# Altium schematic sheet 1_LiPo_Charger.schdoc
size 289 x 200 mm; Name: default297x210; Symbol: default297x210; Device: default297x210; Size: "A4"; Id: /; File: LiPo Charger; Sheet: /; SheetNumber: 12; SheetTotal: 17
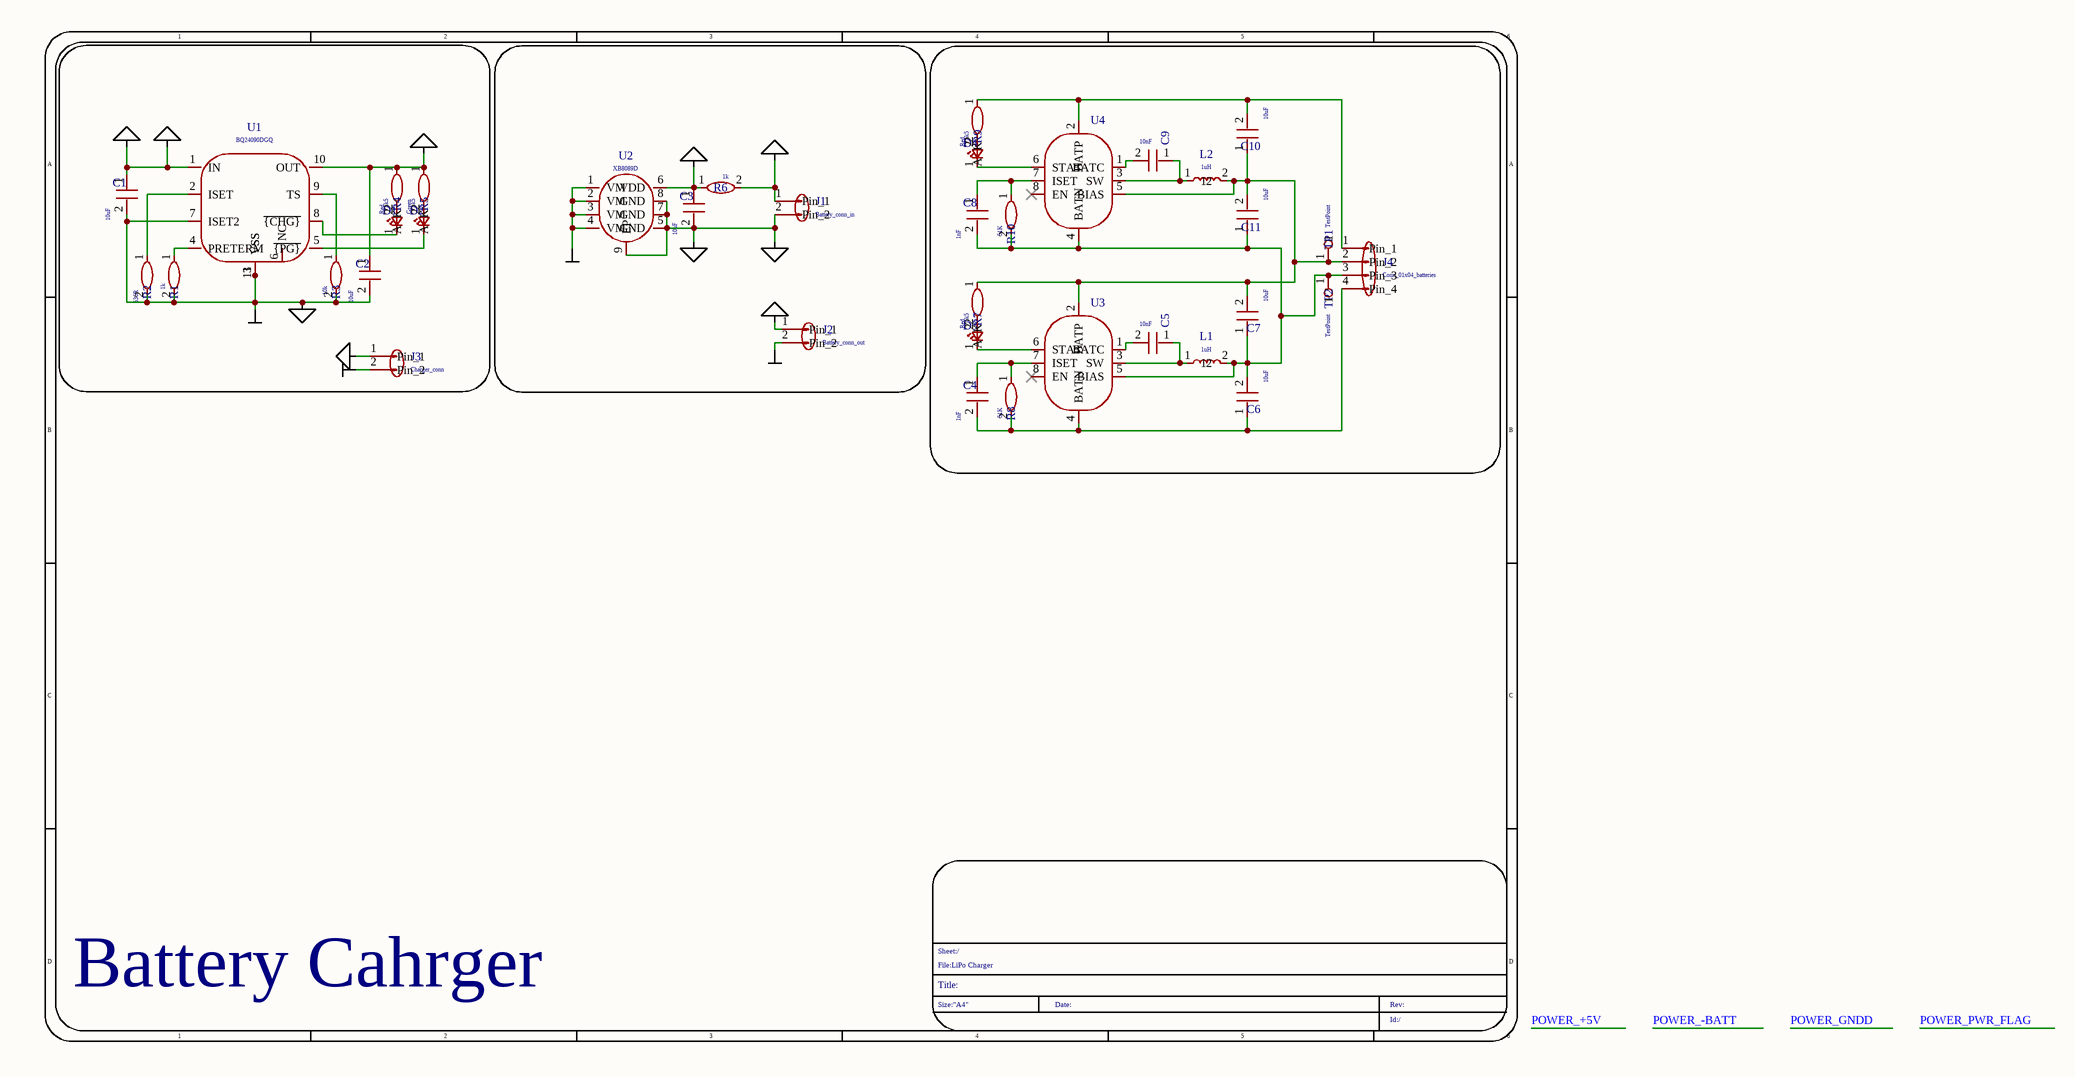
[diagram p0: 1_LiPo_Charger.schdoc]

## Parts
C1  value 10uF  [Capacitor_SMD:C_0402_1005Metric_Pad0.74x0.62mm_HandSolder]  (hidden comment: Device_C)
C2  value 10uF  [Capacitor_SMD:C_0402_1005Metric_Pad0.74x0.62mm_HandSolder]  (hidden comment: Device_C)
C3  value 10uF  [Capacitor_SMD:C_0402_1005Metric_Pad0.74x0.62mm_HandSolder]  (hidden comment: Device_C)
C4  value 1nF  [Capacitor_SMD:C_0402_1005Metric_Pad0.74x0.62mm_HandSolder]  (hidden comment: Device_C)
C5  value 10nF  [Capacitor_SMD:C_0402_1005Metric_Pad0.74x0.62mm_HandSolder]  (hidden comment: Device_C)
C6  value 10uF  [Capacitor_SMD:C_0402_1005Metric_Pad0.74x0.62mm_HandSolder]  (hidden comment: Device_C)
C7  value 10uF  [Capacitor_SMD:C_0402_1005Metric_Pad0.74x0.62mm_HandSolder]  (hidden comment: Device_C)
C8  value 1nF  [Capacitor_SMD:C_0402_1005Metric_Pad0.74x0.62mm_HandSolder]  (hidden comment: Device_C)
C9  value 10nF  [Capacitor_SMD:C_0402_1005Metric_Pad0.74x0.62mm_HandSolder]  (hidden comment: Device_C)
C10  value 10uF  [Capacitor_SMD:C_0402_1005Metric_Pad0.74x0.62mm_HandSolder]  (hidden comment: Device_C)
C11  value 10uF  [Capacitor_SMD:C_0402_1005Metric_Pad0.74x0.62mm_HandSolder]  (hidden comment: Device_C)
D1  value Red  [SparkFun-LED:LED_0603_1608Metric_Red]  (hidden comment: SparkFun-LED_LED_Red_0603)
D2  value Green  [SparkFun-LED:LED_0603_1608Metric_Green]  (hidden comment: SparkFun-LED_LED_Green_0603)
D3  value Red  [SparkFun-LED:LED_0603_1608Metric_Red]  (hidden comment: SparkFun-LED_LED_Red_0603)
D4  value Red  [SparkFun-LED:LED_0603_1608Metric_Red]  (hidden comment: SparkFun-LED_LED_Red_0603)
J1  value Battery_conn_in  [Connector_JST:JST_PH_B2B-PH-K_1x02_P2.00mm_Vertical]  (hidden comment: Connector_Generic_Conn_01x02)
J2  value Battery_conn_out  [Connector_JST:JST_PH_B2B-PH-K_1x02_P2.00mm_Vertical]  (hidden comment: Connector_Generic_Conn_01x02)
J3  value Charger_conn  [Connector_JST:JST_PH_B2B-PH-K_1x02_P2.00mm_Vertical]  (hidden comment: Connector_Generic_Conn_01x02)
J4  value Conn_01x04_batteries  [Connector_JST:JST_EH_B4B-EH-A_1x04_P2.50mm_Vertical]  (hidden comment: Connector_Generic_Conn_01x04)
L1  value 1uH  [Inductor_SMD:L_Sunlord_SWPA3010S]  (hidden comment: Device_L)
L2  value 1uH  [Inductor_SMD:L_Sunlord_SWPA3010S]  (hidden comment: Device_L)
R1  value 1k  [PCM_Resistor_SMD_AKL:R_0201_0603Metric_Pad0.64x0.40mm_HandSolder]  (hidden comment: Device_R)
R2  value 536R  [PCM_Resistor_SMD_AKL:R_0201_0603Metric_Pad0.64x0.40mm_HandSolder]  (hidden comment: Device_R)
R3  value 10k  [PCM_Resistor_SMD_AKL:R_0201_0603Metric_Pad0.64x0.40mm_HandSolder]  (hidden comment: Device_R)
R4  value 1k5  [PCM_Resistor_SMD_AKL:R_0201_0603Metric_Pad0.64x0.40mm_HandSolder]  (hidden comment: Device_R)
R5  value 1k5  [PCM_Resistor_SMD_AKL:R_0201_0603Metric_Pad0.64x0.40mm_HandSolder]  (hidden comment: Device_R)
R6  value 1k  [PCM_Resistor_SMD_AKL:R_0201_0603Metric_Pad0.64x0.40mm_HandSolder]  (hidden comment: Device_R)
R7  value 1k5  [PCM_Resistor_SMD_AKL:R_0201_0603Metric_Pad0.64x0.40mm_HandSolder]  (hidden comment: Device_R)
R8  value 51K  [PCM_Resistor_SMD_AKL:R_0201_0603Metric_Pad0.64x0.40mm_HandSolder]  (hidden comment: Device_R)
R9  value 1k5  [PCM_Resistor_SMD_AKL:R_0201_0603Metric_Pad0.64x0.40mm_HandSolder]  (hidden comment: Device_R)
R10  value 51K  [PCM_Resistor_SMD_AKL:R_0201_0603Metric_Pad0.64x0.40mm_HandSolder]  (hidden comment: Device_R)
TP1  value TestPoint  [TestPoint:TestPoint_Pad_D1.5mm]  (hidden comment: Connector_TestPoint)
TP2  value TestPoint  [TestPoint:TestPoint_Pad_D1.5mm]  (hidden comment: Connector_TestPoint)
U1  value BQ24090DGQ  [Package_SO:HVSSOP-10-1EP_3x3mm_P0.5mm_EP1.57x1.88mm_ThermalVias]  (hidden comment: Battery_Management_BQ24090DGQ)
U2  value XB8089D  [Package_SO:HTSOP-8-1EP_3.9x4.9mm_P1.27mm_EP2.4x3.2mm_ThermalVias]  (hidden comment: Chineness_XB8089D)
U3  Chineness_ETA3000  [Package_DFN_QFN:DFN-8-1EP_2x2mm_P0.5mm_EP0.6x1.2mm]  (value not drawn)
U4  Chineness_ETA3000  [Package_DFN_QFN:DFN-8-1EP_2x2mm_P0.5mm_EP0.6x1.2mm]  (value not drawn)

## Nets
POWER_+5V: C1.1 C1.2 C2.2 C3.1 C3.2 J1.2(Pin_2) J2.2(Pin_2) J3.1(Pin_1) J3.2(Pin_2) R1.2 R2.2 R3.2 R6.1 U1.1(IN) U1.3(VSS) U1.7(ISET2) U1.11(VSS) U2.1(VM) U2.2(VM) U2.3(VM) U2.4(VM) U2.5(GND) U2.6(VDD) U2.7(GND) U2.8(GND) U2.9(EP)  [also labelled POWER_-BATT, POWER_GNDD, POWER_PWR_FLAG]
POWER_+BATT: C2.1 J1.1(Pin_1) J2.1(Pin_1) R4.1 R5.1 R6.2 U1.10(OUT)
NetC4_1: C4.1 R8.1 U3.7(ISET)
NetC4_2: C4.2 C6.1 J4.4(Pin_4) R8.2 U3.4(BATN)
NetC5_1: C5.1 L1.1 U3.3(SW)
NetC5_2: C5.2 U3.1(BATC)
NetC6_2: C6.2 C7.1 C8.2 C11.1 J4.3(Pin_3) L1.2 R10.2 TP2.1 U3.5(BIAS) U4.4(BATN)
NetC7_2: C7.2 C10.1 C11.2 J4.2(Pin_2) L2.2 R7.1 TP1.1 U3.2(BATP) U4.5(BIAS)
NetC8_1: C8.1 R10.1 U4.7(ISET)
NetC9_1: C9.1 L2.1 U4.3(SW)
NetC9_2: C9.2 U4.1(BATC)
NetC10_2: C10.2 J4.1(Pin_1) R9.1 U4.2(BATP)
NetD1_1: D1.1(K) U1.8(~{{CHG}})
NetD1_2: D1.2(A) R4.2
NetD2_1: D2.1(K) U1.5(~{{PG}})
NetD2_2: D2.2(A) R5.2
NetD3_1: D3.1(K) U3.6(STAT)
NetD3_2: D3.2(A) R7.2
NetD4_1: D4.1(K) U4.6(STAT)
NetD4_2: D4.2(A) R9.2
NetR1_1: R1.1 U1.4(PRETERM)
NetR2_1: R2.1 U1.2(ISET)
NetR3_1: R3.1 U1.9(TS)

Not connected (* = marked no-connect by the designer): U1 6(NC); U3 8(EN)*; U4 8(EN)*

## Notes on the sheet
- Battery Cahrger
- 1
- 2
- 3
- 4
- 5
- 6
- A
- B
- C
- D
- File:LiPo Charger
- Sheet:/
- Size:"A4"
- Title:
- Date:
- Rev:
- Id:/

## Library data of the parts
C1-C11 = Device_C: Users: REF**; ki_fp_filters: C_*; Add into BOM: yes; Symbol: Device_C; Device: Device_C; datasheet: ~; User doc link: ~; Convert to PCB: yes; Origin Footprint: Capacitor_SMD:C_0402_1005Metric_Pad0.74x0.62mm_HandSolder
D1 D3 D4 = SparkFun-LED_LED_Red_0603: prod_id: DIO-17976; ki_fp_filters: LED* LED_SMD:* LED_THT:*; Add into BOM: yes; Symbol: SparkFun-LED_LED_Red_0603; Device: SparkFun-LED_LED_Red_0603; datasheet: https://docs.broadcom.com/docs/AV02-0551EN; User doc link: https://docs.broadcom.com/docs/AV02-0551EN; Convert to PCB: yes; Origin Footprint: SparkFun-LED:LED_0603_1608Metric_Red; PROD_ID: DIO-17976
D2 = SparkFun-LED_LED_Green_0603: prod_id: DIO-00821; ki_fp_filters: LED* LED_SMD:* LED_THT:*; Add into BOM: yes; Symbol: SparkFun-LED_LED_Green_0603; Device: SparkFun-LED_LED_Green_0603; datasheet: https://docs.broadcom.com/docs/AV02-0551EN; User doc link: https://docs.broadcom.com/docs/AV02-0551EN; Convert to PCB: yes; Origin Footprint: SparkFun-LED:LED_0603_1608Metric_Green; PROD_ID: DIO-00821
J1-J3 = Connector_Generic_Conn_01x02: Users: REF**; ki_fp_filters: Connector*:*_1x??_*; Add into BOM: yes; Symbol: Connector_Generic_Conn_01x02; Device: Connector_Generic_Conn_01x02; datasheet: ~; User doc link: ~; Convert to PCB: yes; Origin Footprint: Connector_JST:JST_PH_B2B-PH-K_1x02_P2.00mm_Vertical
J4 = Connector_Generic_Conn_01x04: Users: REF**; ki_fp_filters: Connector*:*_1x??_*; Add into BOM: yes; Symbol: Connector_Generic_Conn_01x04; Device: Connector_Generic_Conn_01x04; datasheet: ~; User doc link: ~; Convert to PCB: yes; Origin Footprint: Connector_JST:JST_EH_B4B-EH-A_1x04_P2.50mm_Vertical
L1 L2 = Device_L: Users: REF**; ki_fp_filters: Choke_* *Coil* Inductor_* L_*; Add into BOM: yes; Symbol: Device_L; Device: Device_L; datasheet: ~; User doc link: ~; Convert to PCB: yes; Origin Footprint: Inductor_SMD:L_Sunlord_SWPA3010S
R1-R10 = Device_R: Users: REF**; ki_fp_filters: R_*; Add into BOM: yes; Symbol: Device_R; Device: Device_R; datasheet: ~; User doc link: ~; Convert to PCB: yes; Origin Footprint: PCM_Resistor_SMD_AKL:R_0201_0603Metric_Pad0.64x0.40mm_HandSolder
TP1 TP2 = Connector_TestPoint: Users: REF**; ki_fp_filters: Pin* Test*; Add into BOM: yes; Symbol: Connector_TestPoint; Device: Connector_TestPoint; datasheet: ~; User doc link: ~; Convert to PCB: yes; Origin Footprint: TestPoint:TestPoint_Pad_D1.5mm
U1 = Battery_Management_BQ24090DGQ: Users: REF**; ki_fp_filters: HVSSOP*1EP*3x3mm*P0.5mm*; Add into BOM: yes; Symbol: Battery_Management_BQ24090DGQ; Device: Battery_Management_BQ24090DGQ; datasheet: http://www.ti.com/lit/ds/symlink/bq24090.pdf; User doc link: http://www.ti.com/lit/ds/symlink/bq24090.pdf; Convert to PCB: yes; Origin Footprint: Package_SO:HVSSOP-10-1EP_3x3mm_P0.5mm_EP1.57x1.88mm_ThermalVias
U2 = Chineness_XB8089D: Users: REF**; ki_fp_filters: SOP-8-1EP; Add into BOM: yes; Symbol: Chineness_XB8089D; Device: Chineness_XB8089D; Convert to PCB: yes; Origin Footprint: Package_SO:HTSOP-8-1EP_3.9x4.9mm_P1.27mm_EP2.4x3.2mm_ThermalVias
U3 U4 = Chineness_ETA3000: Users: REF**; Add into BOM: yes; Symbol: Chineness_ETA3000; Device: Chineness_ETA3000; Value: ETA3000; Convert to PCB: yes; Origin Footprint: Package_DFN_QFN:DFN-8-1EP_2x2mm_P0.5mm_EP0.6x1.2mm